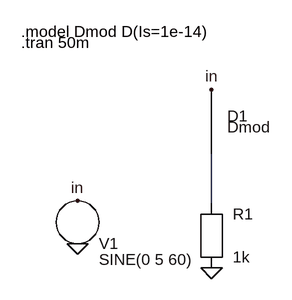
[diagram p0: schematic rectifier_labelled.asc]
rectifier_labelled.asc, the LTspice schematic file:
Version 4
SHEET 1 880 680
WIRE 300 198 300 272
FLAG 100 268 in
FLAG 300 102 in
FLAG 100 332 0
FLAG 300 368 0
SYMBOL voltage 100 300 R0
SYMATTR InstName V1
SYMATTR Value SINE(0 5 60)
SYMBOL diode 300 150 R0
SYMATTR InstName D1
SYMATTR Value Dmod
SYMBOL res 300 320 R0
SYMATTR InstName R1
SYMATTR Value 1k
TEXT 16 16 Left 2 !.model Dmod D(Is=1e-14)
TEXT 16 32 Left 2 !.tran 50m

The netlist it stands for:
* rectifier_labelled.asc
V1 in 0 SINE(0 5 60)
D1 in N001 Dmod
R1 N001 0 1k
.model D D
.lib standard.dio
.model Dmod D(Is=1e-14)
.tran 50m
.backanno
.end